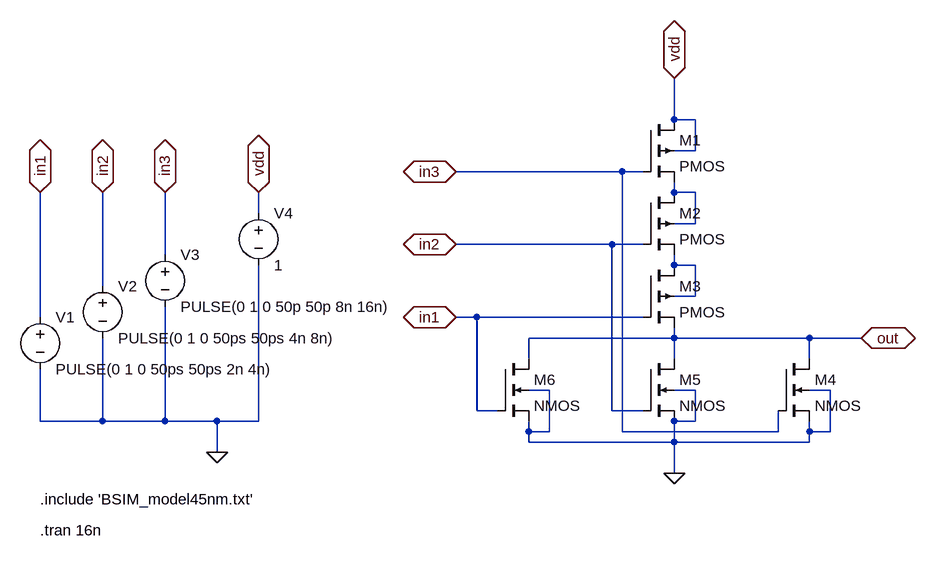
[diagram p0: schematic NOR_3input.asc]
NOR_3input.asc, the LTspice schematic file:
Version 4
SHEET 1 1344 680
WIRE 960 -144 960 -208
WIRE 992 -144 960 -144
WIRE 992 -96 992 -144
WIRE 992 -96 960 -96
WIRE 880 -64 624 -64
WIRE 912 -64 880 -64
WIRE 960 -32 960 -48
WIRE 992 -32 960 -32
WIRE 320 0 320 -32
WIRE 992 16 992 -32
WIRE 992 16 960 16
WIRE 864 48 624 48
WIRE 912 48 864 48
WIRE 176 64 176 -32
WIRE 960 80 960 64
WIRE 992 80 960 80
WIRE 80 112 80 -32
WIRE 992 128 992 80
WIRE 992 128 960 128
WIRE -16 160 -16 -32
WIRE 656 160 624 160
WIRE 912 160 656 160
WIRE 960 192 960 176
WIRE 960 192 736 192
WIRE 1168 192 960 192
WIRE 1248 192 1168 192
WIRE 736 224 736 192
WIRE 960 224 960 192
WIRE 1168 224 1168 192
WIRE 768 272 736 272
WIRE 992 272 960 272
WIRE 1200 272 1168 272
WIRE 656 304 656 160
WIRE 688 304 656 304
WIRE 864 304 864 48
WIRE 912 304 864 304
WIRE -16 320 -16 240
WIRE 80 320 80 192
WIRE 80 320 -16 320
WIRE 176 320 176 144
WIRE 176 320 80 320
WIRE 256 320 176 320
WIRE 320 320 320 80
WIRE 320 320 256 320
WIRE 992 320 992 272
WIRE 992 320 960 320
WIRE 736 336 736 320
WIRE 768 336 768 272
WIRE 768 336 736 336
WIRE 880 336 880 -64
WIRE 1120 336 1120 304
WIRE 1120 336 880 336
WIRE 1168 336 1168 320
WIRE 1200 336 1200 272
WIRE 1200 336 1168 336
WIRE 736 352 736 336
WIRE 960 352 960 320
WIRE 960 352 736 352
WIRE 1168 352 1168 336
WIRE 1168 352 960 352
WIRE 256 368 256 320
WIRE 960 400 960 352
FLAG 256 368 0
FLAG -16 -32 in1
IOPIN -16 -32 BiDir
FLAG 80 -32 in2
IOPIN 80 -32 BiDir
FLAG 176 -32 in3
IOPIN 176 -32 BiDir
FLAG 320 -32 vdd
IOPIN 320 -32 BiDir
FLAG 960 400 0
FLAG 624 160 in1
IOPIN 624 160 BiDir
FLAG 624 48 in2
IOPIN 624 48 BiDir
FLAG 624 -64 in3
IOPIN 624 -64 BiDir
FLAG 960 -208 vdd
IOPIN 960 -208 BiDir
FLAG 1248 192 out
IOPIN 1248 192 BiDir
SYMBOL voltage -16 144 R0
WINDOW 123 0 0 Left 0
WINDOW 39 0 0 Left 0
SYMATTR InstName V1
SYMATTR Value PULSE(0 1 0 50ps 50ps 2n 4n)
SYMBOL voltage 80 96 R0
WINDOW 123 0 0 Left 0
WINDOW 39 0 0 Left 0
SYMATTR InstName V2
SYMATTR Value PULSE(0 1 0 50ps 50ps 4n 8n)
SYMBOL voltage 176 48 R0
WINDOW 123 0 0 Left 0
WINDOW 39 0 0 Left 0
SYMATTR InstName V3
SYMATTR Value PULSE(0 1 0 50p 50p 8n 16n)
SYMBOL voltage 320 -16 R0
WINDOW 123 0 0 Left 0
WINDOW 39 0 0 Left 0
SYMATTR InstName V4
SYMATTR Value 1
SYMBOL pmos4 912 -144 R0
SYMATTR InstName M1
SYMBOL pmos4 912 -32 R0
SYMATTR InstName M2
SYMBOL pmos4 912 80 R0
SYMATTR InstName M3
SYMBOL nmos4 1120 224 R0
SYMATTR InstName M4
SYMBOL nmos4 912 224 R0
SYMATTR InstName M5
SYMBOL nmos4 688 224 R0
SYMATTR InstName M6
TEXT -16 440 Left 2 !.include 'BSIM_model45nm.txt'
TEXT -16 488 Left 2 !.tran 16n

The netlist it stands for:
* NOR_3input.asc
V1 in1 0 PULSE(0 1 0 50ps 50ps 2n 4n)
V2 in2 0 PULSE(0 1 0 50ps 50ps 4n 8n)
V3 in3 0 PULSE(0 1 0 50p 50p 8n 16n)
V4 vdd 0 1
M1 vdd in3 N001 vdd PMOS
M2 N001 in2 N002 N001 PMOS
M3 N002 in1 out N002 PMOS
M4 out in3 0 0 NMOS
M5 out in2 0 0 NMOS
M6 out in1 0 0 NMOS
.model NMOS NMOS
.model PMOS PMOS
.lib standard.mos
.include 'BSIM_model45nm.txt'
.tran 16n
.backanno
.end